# Altium project Sound_Sensor_PoE_v3.2.PrjPcb (part 2 of 4)

## Sheet ADC_Section.SchDoc
size A4; DocumentNumber: 6; SheetNumber: 6; SheetTotal: 11
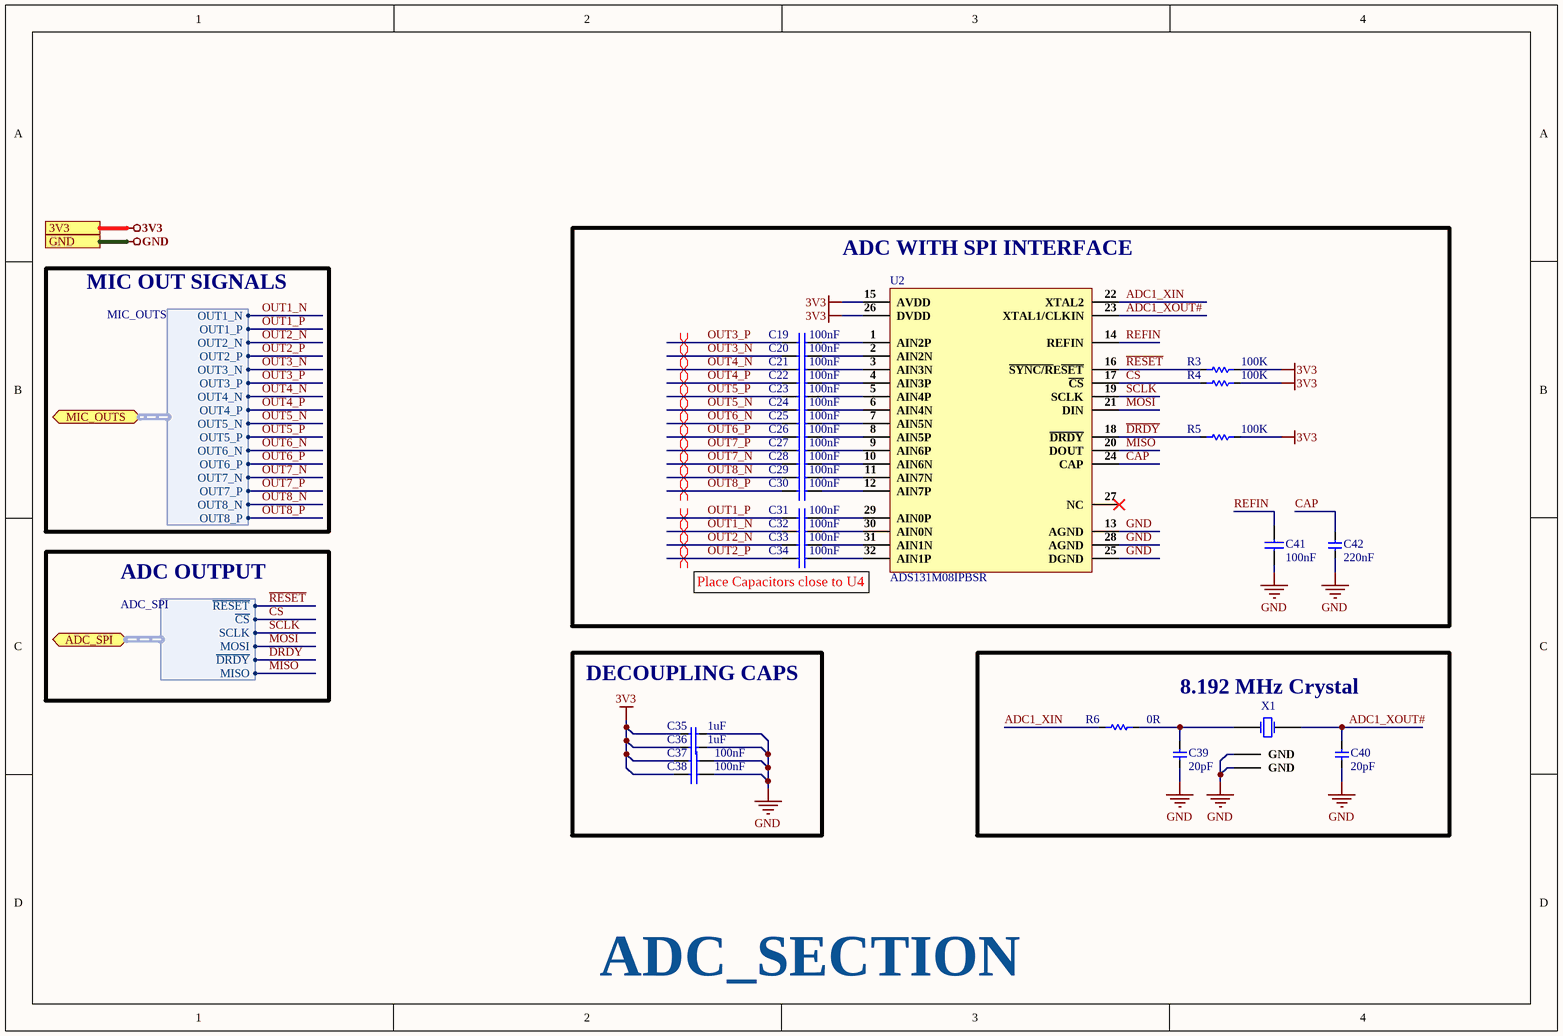
[diagram p4: ADC_Section.SchDoc]

### Parts
C19  100nF  [Cap-0402]
C20  100nF  [Cap-0402]
C21  100nF  [Cap-0402]
C22  100nF  [Cap-0402]
C23  100nF  [Cap-0402]
C24  100nF  [Cap-0402]
C25  100nF  [Cap-0402]
C26  100nF  [Cap-0402]
C27  100nF  [Cap-0402]
C28  100nF  [Cap-0402]
C29  100nF  [Cap-0402]
C30  100nF  [Cap-0402]
C31  100nF  [Cap-0402]
C32  100nF  [Cap-0402]
C33  100nF  [Cap-0402]
C34  100nF  [Cap-0402]
C35  1uF  [Cap-0603]
C36  1uF  [Cap-0603]
C37  100nF  [Cap-0603]
C38  100nF  [Cap-0603]
C39  20pF  [Cap-0603]
C40  20pF  [Cap-0603]
C41  100nF  [Cap-0603]
C42  220nF  [Cap-0805]
R3  100K  [RES-0603]
R4  100K  [RES-0603]
R5  100K  [RES-0603]
R6  0R  [Res-0603]
U2  ADS131M08IPBSR  [32TQFP]
X1  3TJ481920NYLBC  [3TJ481920NYLBC]  (value not drawn)

### Blocks framed on the sheet
ADC WITH SPI INTERFACE: C19-C34 C41 C42 R3-R5 U2
DECOUPLING CAPS: C35-C38
8.192 MHz Crystal: C39 C40 R6 X1

### Ports
3V3, ADC_SPI (bidir, harness ADC_SPI), GND, MIC_OUTS (bidir, harness MIC_OUTS)

### Harnesses
MIC_OUTS: OUT1_N, OUT1_P, OUT2_N, OUT2_P, OUT3_N, OUT3_P, OUT4_N, OUT4_P, OUT5_N, OUT5_P, OUT6_N, OUT6_P, OUT7_N, OUT7_P, OUT8_N, OUT8_P
ADC_SPI: ~{RESET}, ~{CS}, SCLK, MOSI, ~{DRDY}, MISO

### Nets
3V3: C35.1 C36.1 C37.1 C38.1 R3.2 R4.2 R5.2 U2.15(AVDD) U2.26(DVDD) ; port 3V3
GND: C35.2 C36.2 C37.2 C38.2 C39.1 C40.1 C41.2 C42.1 U2.13(AGND) U2.25(DGND) U2.28(AGND) X1.2(GND) X1.4(GND) ; port GND
~{CS}: R4.1 U2.17(~{CS}) ; port ADC_SPI.~{CS}
~{DRDY}: R5.1 U2.18(~{DRDY}) ; port ADC_SPI.~{DRDY}
~{RESET}: R3.1 U2.16(~{SYNC/R}E~{SET}) ; port ADC_SPI.~{RESET}
ADC1_XIN: R6.1 U2.22(XTAL2)
ADC1_XOUT#: C40.2 U2.23(XTAL1/CLKIN) X1.3(OSC2)
CAP: C42.2 U2.24(CAP)
MISO: U2.20(DOUT) ; port ADC_SPI.MISO
MOSI: U2.21(DIN) ; port ADC_SPI.MOSI
OUT1_N: C32.1 ; port MIC_OUTS.OUT1_N  [project net MIC_OUTS.OUT1_N]
OUT1_P: C31.1 ; port MIC_OUTS.OUT1_P  [project net MIC_OUTS.OUT1_P]
OUT2_N: C33.1 ; port MIC_OUTS.OUT2_N  [project net MIC_OUTS.OUT2_N]
OUT2_P: C34.1 ; port MIC_OUTS.OUT2_P  [project net MIC_OUTS.OUT2_P]
OUT3_N: C20.1 ; port MIC_OUTS.OUT3_N  [project net MIC_OUTS.OUT3_N]
OUT3_P: C19.1 ; port MIC_OUTS.OUT3_P  [project net MIC_OUTS.OUT3_P]
OUT4_N: C21.1 ; port MIC_OUTS.OUT4_N  [project net MIC_OUTS.OUT4_N]
OUT4_P: C22.1 ; port MIC_OUTS.OUT4_P  [project net MIC_OUTS.OUT4_P]
OUT5_N: C24.1 ; port MIC_OUTS.OUT5_N  [project net MIC_OUTS.OUT5_N]
OUT5_P: C23.1 ; port MIC_OUTS.OUT5_P  [project net MIC_OUTS.OUT5_P]
OUT6_N: C25.1 ; port MIC_OUTS.OUT6_N  [project net MIC_OUTS.OUT6_N]
OUT6_P: C26.1 ; port MIC_OUTS.OUT6_P  [project net MIC_OUTS.OUT6_P]
OUT7_N: C28.1 ; port MIC_OUTS.OUT7_N  [project net MIC_OUTS.OUT7_N]
OUT7_P: C27.1 ; port MIC_OUTS.OUT7_P  [project net MIC_OUTS.OUT7_P]
OUT8_N: C29.1 ; port MIC_OUTS.OUT8_N  [project net MIC_OUTS.OUT8_N]
OUT8_P: C30.1 ; port MIC_OUTS.OUT8_P  [project net MIC_OUTS.OUT8_P]
REFIN: C41.1 U2.14(REFIN)
SCLK: U2.19(SCLK) ; port ADC_SPI.SCLK
NetC19_2: C19.2 U2.1(AIN2P)
NetC20_2: C20.2 U2.2(AIN2N)
NetC21_2: C21.2 U2.3(AIN3N)
NetC22_2: C22.2 U2.4(AIN3P)
NetC23_2: C23.2 U2.5(AIN4P)
NetC24_2: C24.2 U2.6(AIN4N)
NetC25_2: C25.2 U2.7(AIN5N)
NetC26_2: C26.2 U2.8(AIN5P)
NetC27_2: C27.2 U2.9(AIN6P)
NetC28_2: C28.2 U2.10(AIN6N)
NetC29_2: C29.2 U2.11(AIN7N)
NetC30_2: C30.2 U2.12(AIN7P)
NetC31_2: C31.2 U2.29(AIN0P)
NetC32_2: C32.2 U2.30(AIN0N)
NetC33_2: C33.2 U2.31(AIN1N)
NetC34_2: C34.2 U2.32(AIN1P)
NetC39_2: C39.2 R6.2 X1.1(OSC1)

Not connected (* = marked no-connect by the designer): U2 27(NC)*

### Layout directives
differential pair; differential pair class OUT1_Lines; net class OUT1; rule Impedance Constraint [Min = 85.00    Max = 95.00    ]; rule Matched Net Lengths [Tolerance = 20mil]: MIC_OUTS.OUT1_P
differential pair; differential pair class OUT1_Lines; net class OUT1; rule Matched Net Lengths [Tolerance = 20mil]; rule Impedance Constraint [Min = 85.00    Max = 95.00    ]: MIC_OUTS.OUT1_N
differential pair; differential pair class OUT2_Lines; net class OUT2; rule Matched Net Lengths [Tolerance = 20mil]; rule Impedance Constraint [Min = 85.00    Max = 95.00    ]: MIC_OUTS.OUT2_N, MIC_OUTS.OUT2_P
differential pair; differential pair class OUT3_Lines; net class OUT3; rule Matched Net Lengths [Tolerance = 20mil]; rule Impedance Constraint [Min = 85.00    Max = 95.00    ]: MIC_OUTS.OUT3_N, MIC_OUTS.OUT3_P
differential pair; differential pair class OUT4_Lines; net class OUT4; rule Matched Net Lengths [Tolerance = 20mil]; rule Impedance Constraint [Min = 85.00    Max = 95.00    ]: MIC_OUTS.OUT4_N, MIC_OUTS.OUT4_P
differential pair; differential pair class OUT5_Lines; net class OUT5; rule Matched Net Lengths [Tolerance = 20mil]; rule Impedance Constraint [Min = 85.00    Max = 95.00    ]: MIC_OUTS.OUT5_N, MIC_OUTS.OUT5_P
differential pair; differential pair class OUT6_Lines; net class OUT6; rule Matched Net Lengths [Tolerance = 20mil]; rule Impedance Constraint [Min = 85.00    Max = 95.00    ]: MIC_OUTS.OUT6_N, MIC_OUTS.OUT6_P
differential pair; differential pair class OUT7_Lines; net class OUT7; rule Matched Net Lengths [Tolerance = 20mil]; rule Impedance Constraint [Min = 85.00    Max = 95.00    ]: MIC_OUTS.OUT7_N, MIC_OUTS.OUT7_P
differential pair; differential pair class OUT8_Lines; net class OUT8; rule Matched Net Lengths [Tolerance = 20mil]; rule Impedance Constraint [Min = 85.00    Max = 95.00    ]: MIC_OUTS.OUT8_N, MIC_OUTS.OUT8_P

### Notes on the sheet
- MIC OUT SIGNALS
- ADC OUTPUT
- (near C34) Place Capacitors close to U4
- ADC_SECTION
- File:
- Title:
- Date:
- Page
- Num:
- Total:
- Drawn By: Huzaifa Ali

### Library data of the parts
C19-C34 = CC0402KRX5R7BB104: CAP CER 0.1UF 16V X5R 0402; Manufacturer: Yageo; Tolerance: 10%; Supplier 1: Mouser; Manufacturer Part Number: CC0402KRX5R7BB104; RoHS: Yes; Category: Ceramic Capacitors; Stock 1: 936792; Pricing 1: 1=0.10000, 10=0.02300, 50=0.02300, 100=0.01100, 1000=0.00600, 10000=0.00400 (USD); Mount: Surface Mount; Case/Package: 0402; Number of Pins: 2; Case Code (Metric): 1005; Case Code (Imperial): 0402; Min Operating Temperature: -55°C; Max Operating Temperature: 85°C; Capacitance: 100nF; Dielectric: X5R; Packaging: Tape and Reel; Voltage Rating: 16V; Package Quantity: 1; Voltage Rating (DC): 16V; Termination: SMD/SMT; Resistor Type: Ceramic; Series: CC; Construction: Flat; Length: 1mm; Width: 0.02inch; Height: 0.5mm; Thickness: 0.022inch; Depth: 0.5mm; Radiation Hardening: No; REACH SVHC: Unknown; Lead Free: Lead Free; Halogen Free: Halogen Free; RoHS Compliant: Yes; ComponentLink1URL: https://datasheet.ciiva.com/155/mlccorderingcode-155879.pdf?src-supplier=Digi-Key; ComponentLink1Description: https://datasheet.ciiva.com/155/mlccorderingcode-155879.pdf?src-supplier=Digi-Key; ComponentLink2URL: https://datasheet.ciiva.com/155/mlccorderingcode-155878.pdf?src-supplier=Digi-Key; ComponentLink2Description: https://datasheet.ciiva.com/155/mlccorderingcode-155878.pdf?src-supplier=Digi-Key; ComponentLink3URL: https://datasheet.ciiva.com/155/mlccorderingcode-155880.pdf?src-supplier=Digi-Key; ComponentLink3Description: https://datasheet.ciiva.com/155/mlccorderingcode-155880.pdf?src-supplier=Digi-Key; ComponentLink4URL: https://datasheet.ciiva.com/11464/upy-gphc-x5r-4v-to-50v-12-11464869.pdf?src-supplier=Avnet; ComponentLink4Description: https://datasheet.ciiva.com/11464/upy-gphc-x5r-4v-to-50v-12-11464869.pdf?src-supplier=Avnet; Supplier Part Number 1: 603-CC402KRX5R7BB104; LCSC Part Number: C106204
C35 C36 = CC0603KRX5R8BB105: CAP CER 1UF 25V X5R 0603; Manufacturer: Yageo; Tolerance: 10%; Item Type: Capacitor; Supplier 1: Digi-Key; Manufacturer Part Number: CC0603KRX5R8BB105; RoHS: Yes; Category: Ceramic Capacitors; Stock 1: 919939; Pricing 1: 1=0.12000, 10=0.08400, 50=0.04760, 100=0.03940, 500=0.02764, 1000=0.02288 (USD); Mount: Surface Mount; Case/Package: 0603; Number of Pins: 2; Case Code (Metric): 1608; Case Code (Imperial): 0603; Min Operating Temperature: -55°C; Max Operating Temperature: 85°C; Capacitance: 1uF; Dielectric: X5R; Package Quantity: 1; Voltage Rating: 25V; Packaging: Tape and Reel; Termination: SMD/SMT; Voltage Rating (DC): 25V; Series: CC; Construction: Flat; Length: 1.6mm; Width: 0.031inch; Height: 0.8mm; Thickness: 0.035inch; Depth: 0.8mm; Radiation Hardening: No; REACH SVHC: No SVHC; Lead Free: Lead Free; Halogen Free: Halogen Free; RoHS Compliant: Yes; ComponentLink1URL: https://datasheet.ciiva.com/176/mlccorderingcode-176785.pdf?src-supplier=Digi-Key; ComponentLink1Description: https://datasheet.ciiva.com/176/mlccorderingcode-176785.pdf?src-supplier=Digi-Key; ComponentLink2URL: https://datasheet.ciiva.com/176/mlccorderingcode-176786.pdf?src-supplier=Digi-Key; ComponentLink2Description: https://datasheet.ciiva.com/176/mlccorderingcode-176786.pdf?src-supplier=Digi-Key; ComponentLink3URL: https://datasheet.ciiva.com/176/mlccorderingcode-176787.pdf?src-supplier=Digi-Key; ComponentLink3Description: https://datasheet.ciiva.com/176/mlccorderingcode-176787.pdf?src-supplier=Digi-Key; ComponentLink4URL: https://datasheet.ciiva.com/17436/upy-gphc-x5r-4v-to-50v-12-17436952.pdf?src-supplier=Avnet+Europe; ComponentLink4Description: https://datasheet.ciiva.com/17436/upy-gphc-x5r-4v-to-50v-12-17436952.pdf?src-supplier=Avnet+Europe; ComponentLink5URL: https://datasheet.ciiva.com/7978/1525783-7978171.pdf?src-supplier=Element14; ComponentLink5Description: https://datasheet.ciiva.com/7978/1525783-7978171.pdf?src-supplier=Element14; ComponentLink6URL: https://datasheet.ciiva.com/11586/upy-gphc-x5r-4v-to-50v-12-11586318.pdf?src-supplier=Avnet; ComponentLink6Description: https://datasheet.ciiva.com/11586/upy-gphc-x5r-4v-to-50v-12-11586318.pdf?src-supplier=Avnet; Supplier Part Number 1: 311-1445-1-ND; LCSC Part Number: C14664
C37 C38 C41 = CC0603KRX5R9BB104: CAP CER 0.1UF 50V X5R 0603; Manufacturer: Yageo; Tolerance: 10%; Item Type: Capacitor; Supplier 1: Digi-Key; Manufacturer Part Number: CC0603KRX5R9BB104; RoHS: Yes; Category: Ceramic Capacitors; Stock 1: 152253; Pricing 1: 1=0.10000, 10=0.05200, 50=0.02820, 100=0.02310, 500=0.01648, 1000=0.01294 (USD); Mount: Surface Mount; Case/Package: 0603; Case Code (Imperial): 0603; Case Code (Metric): 1608; Weight: 7.1E-05oz; Min Operating Temperature: -55°C; Max Operating Temperature: 85°C; Capacitance: 100nF; Packaging: Tape and Reel; Voltage Rating: 50V; Dielectric: X5R; Termination: SMD/SMT; Voltage Rating (DC): 50V; Package Quantity: 4000; Length: 0.063inch; Width: 0.031inch; Thickness: 0.035inch; Lead Free: Lead Free; Halogen Free: Halogen Free; ComponentLink1URL: http://www.mouser.com/ds/2/447/Yageo_UPY-GP_NP0_16V-to-50V_9-358835.pdf?src-supplier=Mouser; ComponentLink1Description: http://www.mouser.com/ds/2/447/Yageo_UPY-GP_NP0_16V-to-50V_9-358835.pdf?src-supplier=Mouser; ComponentLink2URL: https://www.yageo.com/upload/media/product/productsearch/datasheet/mlcc/UPY-GPHC_X5R_4V-to-50V_26.pdf?src-supplier=Digi-Key; ComponentLink2Description: https://www.yageo.com/upload/media/product/productsearch/datasheet/mlcc/UPY-GPHC_X5R_4V-to-50V_26.pdf?src-supplier=Digi-Key; ComponentLink3URL: http://www.yageo.com/exep/pages/download/literatures/ProductSelectionGuide%202014_Final_2.pdf?src-supplier=Digi-Key; ComponentLink3Description: http://www.yageo.com/exep/pages/download/literatures/ProductSelectionGuide%202014_Final_2.pdf?src-supplier=Digi-Key; Supplier Part Number 1: 311-4046-1-ND; LCSC Part Number: C110022
C39 C40 = CC0603JRNPO9BN200: CAP CER 20PF 50V C0G/NPO 0603; Manufacturer: Yageo; Tolerance: 5%; Dielectric: C0G; Item Type: Capacitor; Supplier 1: Digi-Key; Manufacturer Part Number: CC0603JRNPO9BN200; Stock 1: 259568; Pricing 1: 1=0.1, 10=0.048, 100=0.0214, 500=0.01526, 1000=0.01198 (USD); Mount: Surface Mount; Case/Package: 0603; Number of Pins: 2; Weight: 7.1E-05oz; Case Code (Imperial): 0603; Case Code (Metric): 1608; Min Operating Temperature: -55°C; Max Operating Temperature: 125°C; Capacitance: 20pF; Package Quantity: 4000; Voltage Rating (DC): 50V; Packaging: Tape and Reel; Voltage Rating: 50V; Termination: SMD/SMT; Composition: Ceramic; Length: 1.6mm; Width: 0.8mm; Thickness: 0.035inch; Depth: 0.8mm; REACH SVHC: Unknown; Lead Free: Lead Free; ComponentLink1URL: http://www.farnell.com/datasheets/1132289.pdf?src-supplier=Element14; ComponentLink1Description: http://www.farnell.com/datasheets/1132289.pdf?src-supplier=Element14; ComponentLink2URL: http://www.yageo.com/documents/recent/UPY-GP_NP0_16V-to-50V_16.pdf?src-supplier=Digi-Key; ComponentLink2Description: http://www.yageo.com/documents/recent/UPY-GP_NP0_16V-to-50V_16.pdf?src-supplier=Digi-Key; Supplier Part Number 1: 311-1424-6-ND; LCSC Part Number: C105621
C42 = 08051C224K4T2A: CAP CER 0.22UF 100V X7R 0805; Manufacturer: Kyocera AVX; Tolerance: 10%; Item Type: Capacitor; Supplier 1: Digi-Key; Manufacturer Part Number: 08051C224K4T2A; RoHS: Yes; Category: Ceramic Capacitors; Stock 1: 151; Pricing 1: 1=0.27000, 10=0.18500, 50=0.12320, 100=0.10470, 500=0.07392, 1000=0.06468 (USD); Mount: Surface Mount; Case/Package: 0805; Contact Plating: Tin; Min Operating Temperature: -55°C; Max Operating Temperature: 125°C; Termination: Wraparound; Capacitance: 220nF; Dielectric: X7R; Voltage Rating (DC): 100V; Length: 2.01mm; RoHS Compliant: Yes; ComponentLink1URL: http://datasheets.avx.com/AutoMLCC.pdf?src-supplier=Avnet+Asia; ComponentLink1Description: http://datasheets.avx.com/AutoMLCC.pdf?src-supplier=Avnet+Asia; Supplier Part Number 1: 478-13049-1-ND; LCSC Part Number: C2176107
R3-R5 = CRGH0603J100K: RES SMD 100K OHM 5% 1/5W 0603; Manufacturer: TE Connectivity; Resistance: 100kR; Temperature Coefficient: 100ppm/°C; Power Rating: 200mW; Voltage Rating: 50V; Number of Resistors: 1; Item Type: Resistor; Supplier 1: Digi-Key; Manufacturer Part Number: CRGH0603J100K; Stock 1: 23277; Pricing 1: 1=0.1, 10=0.049, 100=0.02, 1000=0.00899, 2500=0.0078 (USD); Mount: Surface Mount; Case/Package: 0603; Case Code (Imperial): 0603; Case Code (Metric): 1608; Min Operating Temperature: -55°C; Max Operating Temperature: 125°C; Tolerance: 5%; Packaging: Tape and Reel; Resistor Type: Thick Film,Power resistor; Number of Terminations: 2; Series: CRGH; Termination: Solder; Voltage Rating (DC): 50V; Resistance Tolerance: 5%; Technology: THICK FILM; Length: 1.6mm; Width: 0.8mm; Height: 0.45mm; Depth: 0.8mm; RoHS Compliant: Yes; REACH SVHC: No SVHC; ELV: Compliant; ComponentLink1URL: http://www.farnell.com/datasheets/2007183.pdf?src-supplier=Element14; ComponentLink1Description: http://www.farnell.com/datasheets/2007183.pdf?src-supplier=Element14; Supplier Part Number 1: A126393DKR-ND; LCSC Part Number: C2074142
R6 = RC0603JR-070RL: RES 0 OHM JUMPER 1/10W 0603; Manufacturer: Yageo; Resistance: 0mR; Tolerance: 1%; Power Rating: 100mW; Voltage Rating (DC): 50V; Temperature Coefficient: 200ppm/°C; Resistance Tolerance: 5%; Item Type: Resistor; Supplier 1: Digi-Key; Manufacturer Part Number: RC0603JR-070RL; RoHS: Yes; Category: Chip SMD Resistors; Stock 1: 18081776; Pricing 1: 1=0.10000, 10=0.01700, 25=0.01240, 50=0.00960, 100=0.00700, 250=0.00536, 500=0.00430, 1000=0.00316 (USD); Case/Package: 0603; Number of Pins: 2; Contact Plating: Tin,Matte; Case Code (Imperial): 0603; Case Code (Metric): 1608; Size Code: 0603; Min Operating Temperature: -55°C; Max Operating Temperature: 155°C; Resistor Type: Thick Film; Packaging: Tape and Reel; Termination: SMD/SMT; Series: RC; Technology: THICK FILM; Package Quantity: 5000; Voltage Rating: 50V; Features: Moisture Resistant; Max Power Dissipation: 100mW; Number of Terminations: 2; Construction: Rectangular; Length: 1.6mm; Width: 0.8mm; Height: 0.45mm; Depth: 0.8mm; Radiation Hardening: No; Reach SVHC Compliant: No SVHC; Lead Free: Lead Free; RoHS Compliant: Yes; Military Standard: Not; Supplier Part Number 1: 311-0.0GRCT-ND; LCSC Part Number: C95177
U2 = ADS131M08IPBSR: IC ADC 24BIT SIGMA-DELTA 32TQFP; Manufacturer: Texas Instruments; Supplier 1: Mouser; Manufacturer Part Number: ADS131M08IPBSR; RoHS: Yes; Category: Analog to Digital Converters (ADCs); Pricing 1: 1=8.85000, 10=7.99000, 50=7.62000, 100=6.62000, 1000=5.39000, 10000=5.39000 (USD); Supplier Part Number 1: 595-ADS131M08IPBSR
X1 = 3TJ481920NYLBC: 8.192MHz SMD Crystal Resonator 12pF 150Ω ±10ppm ±30ppm -40℃~+85℃ SMD_3225_4P Crystals ROHS; Manufacturer: JYJE; Manufacturer Part No: 3TJ481920NYLBC; Package: Custom

## Sheet Controller_Sheet.SchDoc
size A4; DocumentNumber: 5; SheetNumber: 5; SheetTotal: 11
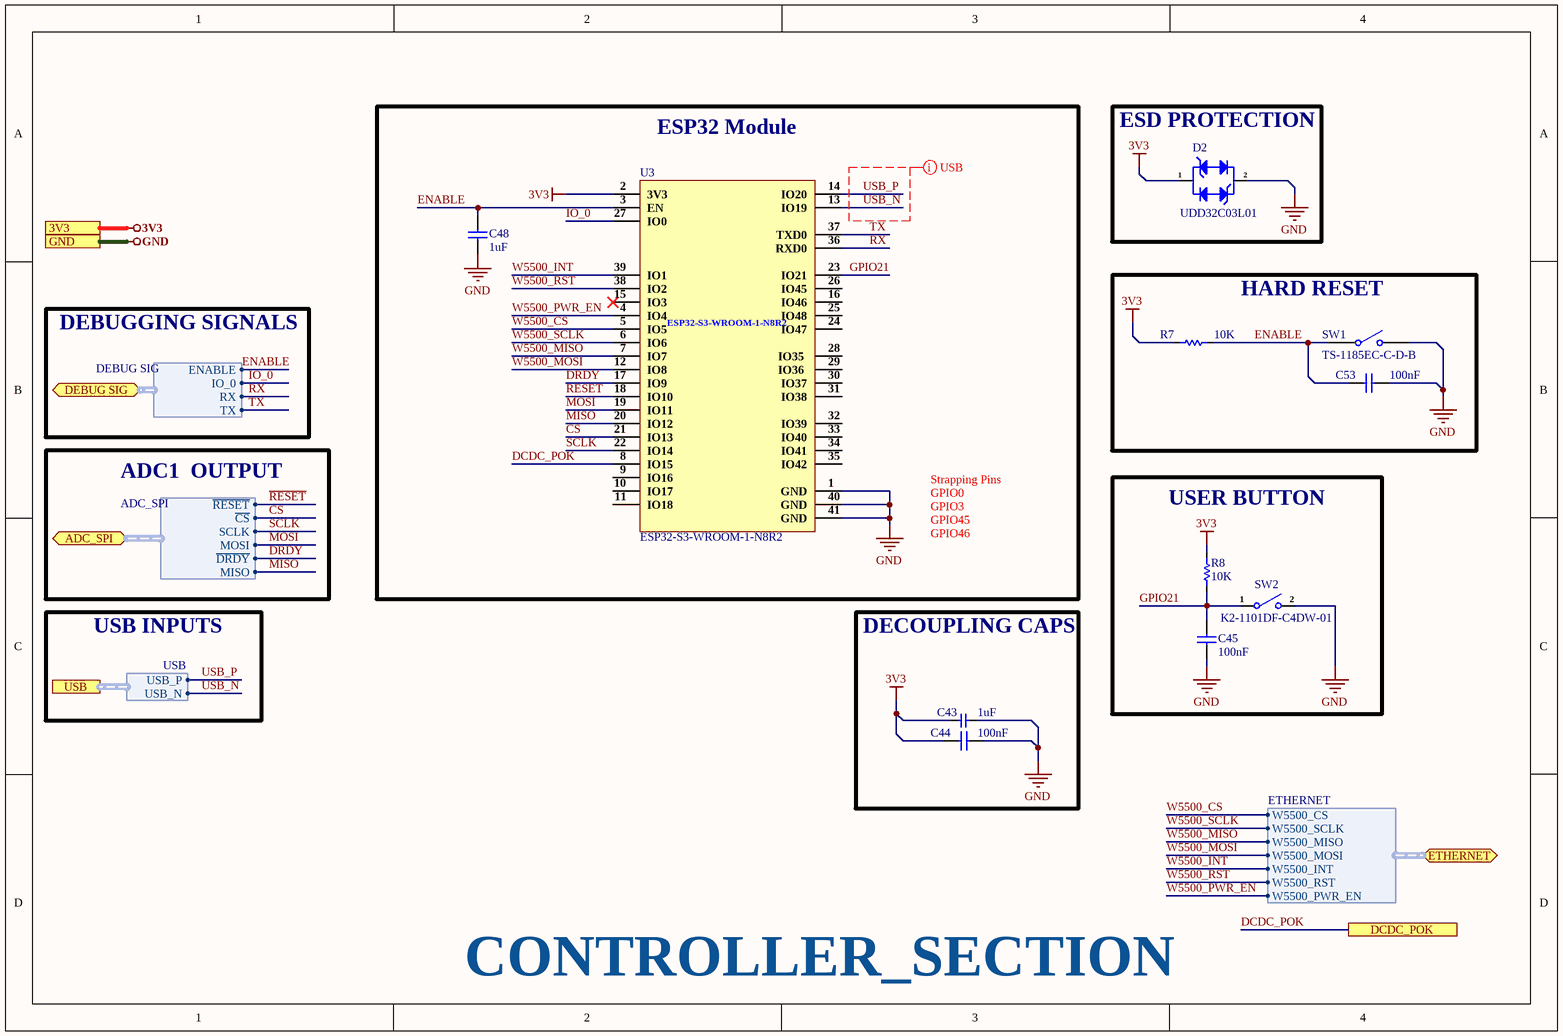
[diagram p5: Controller_Sheet.SchDoc]

### Parts
C43  1uF  [Cap-0603]
C44  100nF  [Cap-0603]
C45  100nF  [Cap-0603]
C48  1uF  [Cap-0402]
C53  100nF  [Cap-0603]
D2  UDD32C03L01  [SOD-323]
R7  10K  [Res-0603]
R8  10K  [Res-0603]
SW1  TS-1185EC-C-D-B  [TS-1185EC-C-D-B]
SW2  K2-1101DF-C4DW-01  [K2-1101DF-C4DW-01]
U3  ESP32-S3-WROOM-1-N8R2  [41-SMD Module]

### Blocks framed on the sheet
ESP32 Module: C48 U3
ESD PROTECTION: D2
HARD RESET: C53 R7 SW1
USER BUTTON: C45 R8 SW2
DECOUPLING CAPS: C43 C44

### Ports
3V3, ADC_SPI (bidir, harness ADC_SPI), DCDC_POK, DEBUG SIG (bidir, harness DEBUG SIG), ETHERNET (bidir, harness ETHERNET), GND, USB (harness USB)

### Harnesses
ADC_SPI: ~{RESET}, ~{CS}, SCLK, MOSI, ~{DRDY}, MISO
USB: USB_P, USB_N
DEBUG SIG: ENABLE, IO_0, RX, TX
ETHERNET: W5500_CS, W5500_SCLK, W5500_MISO, W5500_MOSI, W5500_PWR_EN, W5500_INT, W5500_RST

### Nets
3V3: C43.1 C44.1 D2.1 R7.1 R8.2 U3.2(3V3) ; port 3V3
GND: C43.2 C44.2 C45.1 C48.1 C53.2 D2.2 SW1.2 SW2.2 U3.1(GND) U3.40(GND) U3.41(GND) ; port GND
~{CS}: U3.21(IO13) ; port ADC_SPI.~{CS}
~{DRDY}: U3.17(IO9) ; port ADC_SPI.~{DRDY}
~{RESET}: U3.18(IO10) ; port ADC_SPI.~{RESET}
DCDC_POK: U3.8(IO15) ; port DCDC_POK
ENABLE: C48.2 C53.1 R7.2 SW1.1 U3.3(EN) ; port DEBUG SIG.ENABLE  [project net DEBUG SIG.ENABLE]
GPIO21: C45.2 R8.1 SW2.1 U3.23(IO21)
IO_0: U3.27(IO0) ; port DEBUG SIG.IO_0  [project net DEBUG SIG.IO_0]
MISO: U3.20(IO12) ; port ADC_SPI.MISO
MOSI: U3.19(IO11) ; port ADC_SPI.MOSI
RX: U3.36(RXD0) ; port DEBUG SIG.RX  [project net DEBUG SIG.RX]
SCLK: U3.22(IO14) ; port ADC_SPI.SCLK
TX: U3.37(TXD0) ; port DEBUG SIG.TX  [project net DEBUG SIG.TX]
USB_N: U3.13(IO19) ; port USB.USB_N  [project net USB.USB_N]
USB_P: U3.14(IO20) ; port USB.USB_P  [project net USB.USB_P]
W5500_CS: U3.5(IO5) ; port ETHERNET.W5500_CS
W5500_INT: U3.39(IO1) ; port ETHERNET.W5500_INT
W5500_MISO: U3.7(IO7) ; port ETHERNET.W5500_MISO
W5500_MOSI: U3.12(IO8) ; port ETHERNET.W5500_MOSI
W5500_PWR_EN: U3.4(IO4) ; port ETHERNET.W5500_PWR_EN
W5500_RST: U3.38(IO2) ; port ETHERNET.W5500_RST
W5500_SCLK: U3.6(IO6) ; port ETHERNET.W5500_SCLK

Not connected (* = marked no-connect by the designer): U3 9(IO16) 10(IO17) 11(IO18) 15(IO3)* 16(IO46) 24(IO47) 25(IO48) 26(IO45) 28(IO35_) 29(IO36_) 30(IO37) 31(IO38) 32(IO39) 33(IO40) 34(IO41) 35(IO42)

### Layout directives
differential pair; net class USB; differential pair class USB_Lines; rule Matched Net Lengths [Tolerance = 20mil]; rule Impedance Constraint [Min = 85.00    Max = 95.00    ]: USB_N, USB_P

### Notes on the sheet
- DEBUGGING SIGNALS
- ADC1  OUTPUT
- Strapping Pins
  GPIO0
  GPIO3
  GPIO45
  GPIO46
- USB INPUTS
- CONTROLLER_SECTION
- File:
- Title:
- Date:
- Page
- Num:
- Total:
- Drawn By: Huzaifa Ali

### Library data of the parts
C43 = CC0603KRX5R8BB105: as C35 on sheet ADC_Section; Supplier 1: Digi-Key; Manufacturer Part Number: CC0603KRX5R8BB105; RoHS: Yes; Category: Ceramic Capacitors; Stock 1: 919939; Pricing 1: 1=0.12000, 10=0.08400, 50=0.04760, 100=0.03940, 500=0.02764, 1000=0.02288 (USD); Mount: Surface Mount; Case/Package: 0603; Case Code (Metric): 1608; Case Code (Imperial): 0603; Min Operating Temperature: -55°C; Max Operating Temperature: 85°C; Packaging: Tape and Reel; Capacitance: 1uF; Voltage Rating: 25V; Dielectric: X5R; Termination: SMD/SMT; Voltage Rating (DC): 25V; Package Quantity: 1; Length: 1.6mm; Width: 0.031inch; Thickness: 0.035inch; Lead Free: Lead Free; Halogen Free: Halogen Free; RoHS Compliant: Yes; ComponentLink1URL: https://datasheet.ciiva.com/176/mlccorderingcode-176785.pdf?src-supplier=Digi-Key; ComponentLink1Description: https://datasheet.ciiva.com/176/mlccorderingcode-176785.pdf?src-supplier=Digi-Key; ComponentLink2URL: https://datasheet.ciiva.com/176/mlccorderingcode-176786.pdf?src-supplier=Digi-Key; ComponentLink2Description: https://datasheet.ciiva.com/176/mlccorderingcode-176786.pdf?src-supplier=Digi-Key; ComponentLink3URL: https://datasheet.ciiva.com/176/mlccorderingcode-176787.pdf?src-supplier=Digi-Key; ComponentLink3Description: https://datasheet.ciiva.com/176/mlccorderingcode-176787.pdf?src-supplier=Digi-Key; Supplier Part Number 1: 311-1445-1-ND; LCSC Part Number: C14664; Number of Pins: 2; Series: CC; Construction: Flat; Height: 0.8mm; Depth: 0.8mm; Radiation Hardening: No; REACH SVHC: No SVHC; ComponentLink4URL: https://datasheet.ciiva.com/17436/upy-gphc-x5r-4v-to-50v-12-17436952.pdf?src-supplier=Avnet+Europe; ComponentLink4Description: https://datasheet.ciiva.com/17436/upy-gphc-x5r-4v-to-50v-12-17436952.pdf?src-supplier=Avnet+Europe; ComponentLink5URL: https://datasheet.ciiva.com/7978/1525783-7978171.pdf?src-supplier=Element14; ComponentLink5Description: https://datasheet.ciiva.com/7978/1525783-7978171.pdf?src-supplier=Element14; ComponentLink6URL: https://datasheet.ciiva.com/11586/upy-gphc-x5r-4v-to-50v-12-11586318.pdf?src-supplier=Avnet; ComponentLink6Description: https://datasheet.ciiva.com/11586/upy-gphc-x5r-4v-to-50v-12-11586318.pdf?src-supplier=Avnet
C44 C45 C53 = CC0603KRX5R9BB104: as C37 on sheet ADC_Section; Supplier 1: Digi-Key; Manufacturer Part Number: CC0603KRX5R9BB104; RoHS: Yes; Category: Ceramic Capacitors; Stock 1: 152253; Pricing 1: 1=0.10000, 10=0.05200, 50=0.02820, 100=0.02310, 500=0.01648, 1000=0.01294 (USD); Mount: Surface Mount; Case/Package: 0603; Case Code (Imperial): 0603; Case Code (Metric): 1608; Weight: 7.1E-05oz; Min Operating Temperature: -55°C; Max Operating Temperature: 85°C; Capacitance: 100nF; Packaging: Tape and Reel; Voltage Rating: 50V; Dielectric: X5R; Termination: SMD/SMT; Voltage Rating (DC): 50V; Package Quantity: 4000; Length: 0.063inch; Width: 0.031inch; Thickness: 0.035inch; Lead Free: Lead Free; Halogen Free: Halogen Free; ComponentLink1URL: http://www.mouser.com/ds/2/447/Yageo_UPY-GP_NP0_16V-to-50V_9-358835.pdf?src-supplier=Mouser; ComponentLink1Description: http://www.mouser.com/ds/2/447/Yageo_UPY-GP_NP0_16V-to-50V_9-358835.pdf?src-supplier=Mouser; ComponentLink2URL: https://www.yageo.com/upload/media/product/productsearch/datasheet/mlcc/UPY-GPHC_X5R_4V-to-50V_26.pdf?src-supplier=Digi-Key; ComponentLink2Description: https://www.yageo.com/upload/media/product/productsearch/datasheet/mlcc/UPY-GPHC_X5R_4V-to-50V_26.pdf?src-supplier=Digi-Key; ComponentLink3URL: http://www.yageo.com/exep/pages/download/literatures/ProductSelectionGuide%202014_Final_2.pdf?src-supplier=Digi-Key; ComponentLink3Description: http://www.yageo.com/exep/pages/download/literatures/ProductSelectionGuide%202014_Final_2.pdf?src-supplier=Digi-Key; Supplier Part Number 1: 311-4046-1-ND; LCSC Part Number: C110022
C48 = CC0402KRX5R8BB105: CAP CER 1UF 25V X5R 0402; Manufacturer: Yageo; Tolerance: 10%; Supplier 1: Mouser; Manufacturer Part Number: CC0402KRX5R8BB105; RoHS: Yes; Category: Ceramic Capacitors; Stock 1: 91975; Pricing 1: 1=0.30000, 10=0.20400, 50=0.20400, 100=0.11600, 1000=0.07200, 10000=0.05900 (USD); Mount: Surface Mount; Case/Package: 0402; Case Code (Metric): 1005; Case Code (Imperial): 0402; Weight: 2.3E-05oz; Min Operating Temperature: -55°C; Max Operating Temperature: 85°C; Packaging: Tape and Reel; Capacitance: 1uF; Voltage Rating: 25V; Dielectric: X5R; Termination: SMD/SMT; Voltage Rating (DC): 25V; Package Quantity: 10000; Length: 0.039inch; Width: 0.02inch; Thickness: 0.022inch; Lead Free: Lead Free; Halogen Free: Halogen Free; RoHS Compliant: Yes; ComponentLink1URL: http://www.mouser.com/ds/2/447/Yageo_UPY-GP_NP0_16V-to-50V_9-358835.pdf?src-supplier=Mouser; ComponentLink1Description: http://www.mouser.com/ds/2/447/Yageo_UPY-GP_NP0_16V-to-50V_9-358835.pdf?src-supplier=Mouser; ComponentLink2URL: http://www.yageo.com/documents/recent/UPY-GPHC_X5R_4V-to-50V_25.pdf?src-supplier=Digi-Key; ComponentLink2Description: http://www.yageo.com/documents/recent/UPY-GPHC_X5R_4V-to-50V_25.pdf?src-supplier=Digi-Key; ComponentLink3URL: https://4donline.ihs.com/images/VipMasterIC/IC/YAGO/YAGO-S-A0006851646/YAGO-S-A0006851646-1.pdf?hkey=6D3A4C79FDBF58556ACFDE234799DDF0&src-supplier=Newark; ComponentLink3Description: https://4donline.ihs.com/images/VipMasterIC/IC/YAGO/YAGO-S-A0006851646/YAGO-S-A0006851646-1.pdf?hkey=6D3A4C79FDBF58556ACFDE234799DDF0&src-supplier=Newark; Supplier Part Number 1: 603-CC402KRX5R8BB105; LCSC Part Number: C326568
D2 = UDD32C03L01: 15V 19A 3.3V 4V Bidirectional SOD-323 ESD Protection Devices ROHS; Manufacturer: Brightking; Item Type: ESD Diode; Manufacturer Part Number: UDD32C03L01; ComponentLink1Description: LCSC; ComponentLink1URL: https://lcsc.com/product-detail/span-style-background-color-ff0-ESD-span-Protection-Devices_Brightking-Elec-TAIWAN-UDD32C03L01_C78439.html; LCSC Part Number: C78439
R7 R8 = AC0603JR-0710KL: RES SMD 10K OHM 5% 1/10W 0603; Manufacturer: Yageo; Voltage Rating: 50V; Resistance: 10kR; Power Rating: 100mW; Temperature Coefficient: 100ppm/°C; Item Type: Resistor; Supplier 1: Future Electronics; Manufacturer Part Number: AC0603JR-0710KL; RoHS: Yes; Category: Chip SMD Resistors; Stock 1: 1533000; Pricing 1: 5000=0.00540 (USD); Case/Package: 0603; Case Code (Imperial): 0603; Case Code (Metric): 1608; Size Code: 0603; Min Operating Temperature: -55°C; Max Operating Temperature: 155°C; Packaging: Tape and Reel; Tolerance: 5%; Package Quantity: 1; Resistor Type: Thick Film; Termination: SMD/SMT; Number of Terminations: 2; Max Power Dissipation: 100mW; Features: Moisture Resistant,Automotive AEC-Q200,Anti-Sulfur; Series: AC; Construction: Rectangular; Length: 0.063inch; Width: 0.031inch; Height: 0.022inch; Depth: 0.8mm; Military Standard: Not; Lead Free: Lead Free; RoHS Compliant: Yes; ComponentLink1URL: https://datasheet.ciiva.com/5562/pyu-ac-51-rohs-l-2-5562553.pdf?src-supplier=Mouser; ComponentLink1Description: https://datasheet.ciiva.com/5562/pyu-ac-51-rohs-l-2-5562553.pdf?src-supplier=Mouser; Supplier Part Number 1: 1029044; LCSC Part Number: C140867
SW1 = TS-1185EC-C-D-B: 3mm 2mm Round Button 50mA Top3.65mm SPST 12V SMD Tactile Switches; Manufacturer: XKB; Manufacturer Part No: TS-1185EC-C-D-B; Package: Custom; ComponentLink1Description: LCSC; ComponentLink1URL: https://lcsc.com/product-detail/Tactile-Switches_XKB-Connectivity-TS-1185EC-C-D-B_C318893.html
SW2 = K2-1101DF-C4DW-01: 50mA Lying 100MΩ 100000 Times 250gf@±30gf 12V Plugin Tactile Switches ROHS; Manufacturer: Korean Hroparts Elec; Manufacturer Part Number: K2-1101DF-C4DW-01; Package: Plugin; LCSC Part Number: C502329; Item Type: Tactile Switch; ComponentLink1Description: LCSC; ComponentLink1URL: https://www.lcsc.com/product-detail/Tactile-Switches_Korean-Hroparts-Elec-K2-1101DF-C4DW-01_C502329.html
U3 = ESP32-S3-WROOM-1-N8R2: SMD,18x25.5mm WiFi Modules ROHS; Manufacturer: Espressif Systems; Item Type: Module; Supplier 1: Digi-Key; Manufacturer Part Number: ESP32-S3-WROOM-1-N8R2; RoHS: No; Category: Uncategorized; Supplier Part Number 1: 1965-ESP32-S3-WROOM-1-N8R2-ND; LCSC Part Number: C2913204; ComponentLink1Description: LCSC; ComponentLink1URL: https://www.lcsc.com/product-detail/WiFi-Modules_Espressif-Systems-ESP32-S3-WROOM-1-N8R2_C2913204.html

## Sheet Ethernet_PoE.SchDoc
size A3
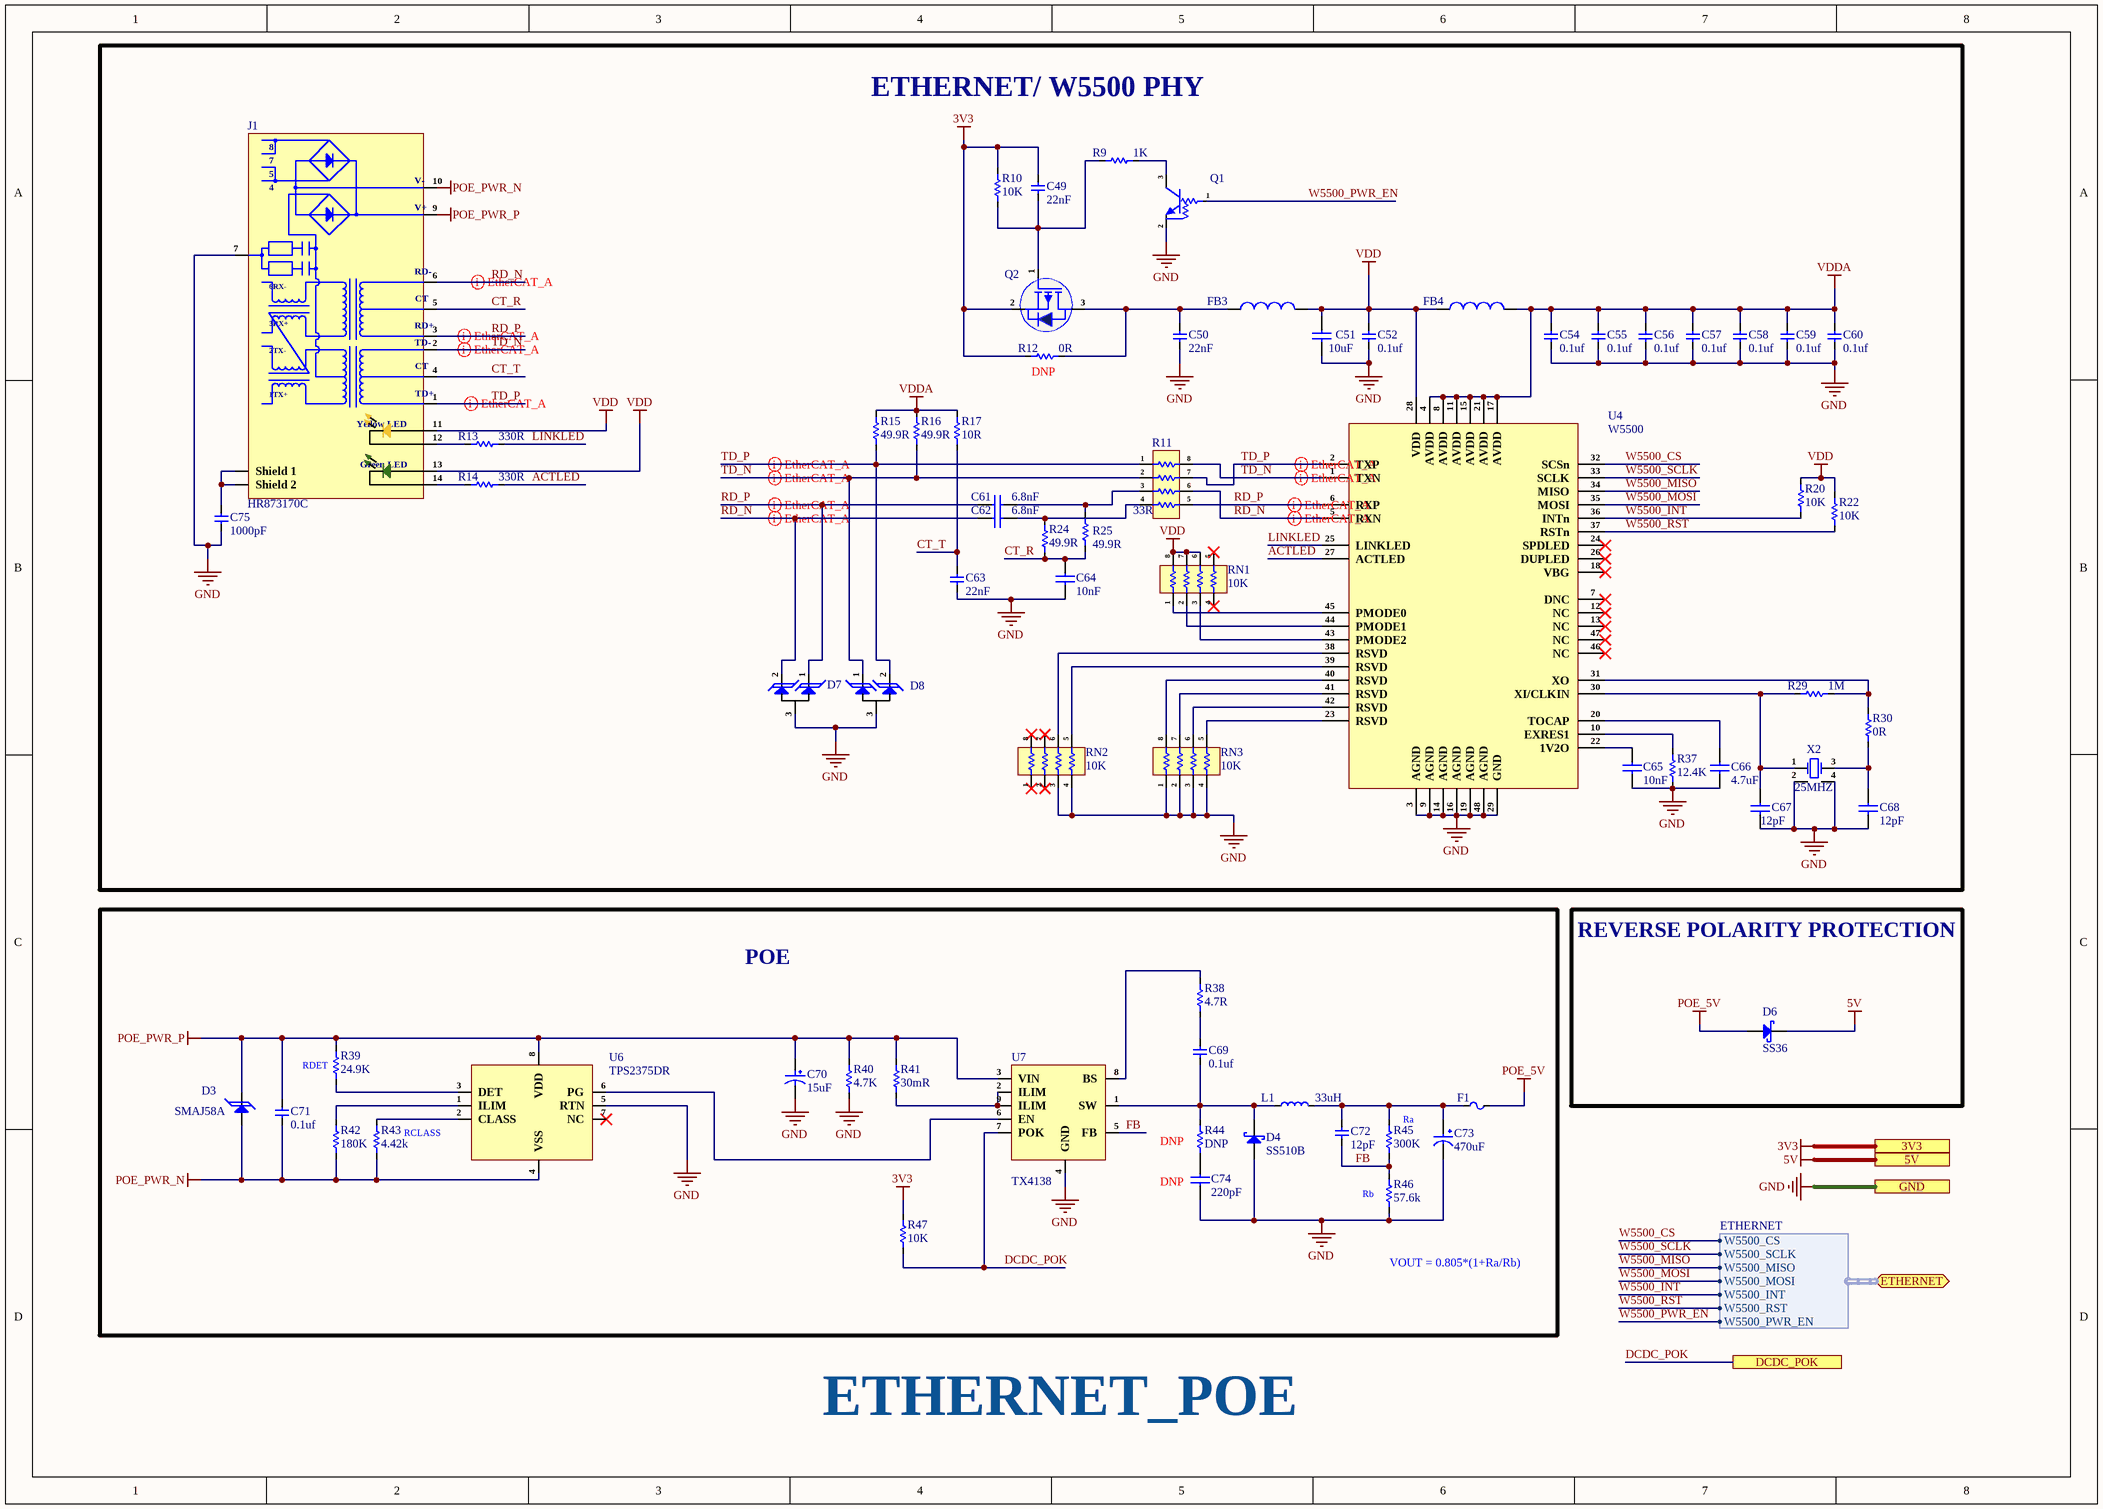
[diagram p6: Ethernet_PoE.SchDoc]

### Parts
C49  22nF  [Cap-0402]
C50  22nF  [Cap-0402]
C51  10uF  [Cap-0603]
C52  0.1uf  [Cap-0402]
C54  0.1uf  [Cap-0402]
C55  0.1uf  [Cap-0402]
C56  0.1uf  [Cap-0402]
C57  0.1uf  [Cap-0402]
C58  0.1uf  [Cap-0402]
C59  0.1uf  [Cap-0402]
C60  0.1uf  [Cap-0402]
C61  6.8nF  [Cap-0603]
C62  6.8nF  [Cap-0603]
C63  22nF  [Cap-0402]
C64  10nF  [Cap-0603]
C65  10nF  [Cap-0603]
C66  4.7uF  [Cap-0603]
C67  12pF  [Cap-0603]
C68  12pF  [Cap-0603]
C69  0.1uf  [Cap-0402]
C70  15uF  [VMMC0571J150MV]
C71  0.1uf  [Cap-0402]
C72  12pF  [Cap-0603]
C73  470uF  [Case-E]
C74  220pF  [Cap 0402]
C75  1000pF  [Cap-1206]
D3  SMAJ58A  [SMA]
D4  SS510B  [SMB_]
D6  SS36  [SMA]
D7  SP0502BAHTG  [SOT-23]  (value not drawn)
D8  SP0502BAHTG  [SOT-23]  (value not drawn)
F1  BSMD0805L-200  [Fuse-0805]  (value not drawn)
FB3  FBMH3225HM601NT  [IND-1210]  (value not drawn)
FB4  FBMH3225HM601NT  [IND-1210]  (value not drawn)
J1  HR873170C  [HR873170C]
L1  33uH  [MDA7050_330M]
Q1  LMUN2211LT1G  [SOT-23]  (value not drawn)
Q2  AO3407  [SOT-23]  (value not drawn)
R9  1K  [Res-0603]
R10  10K  [Res-0603]
R11  33R  [YC164-JR-0733RL]
R12  0R  [Res-0603]
R13  330R  [Res-0603]
R14  330R  [Res-0603]
R15  49.9R  [Res-0201]
R16  49.9R  [Res-0201]
R17  10R  [Res-0603]
R20  10K  [Res-0603]
R22  10K  [Res-0603]
R24  49.9R  [Res-0201]
R25  49.9R  [Res-0201]
R29  1M  [Res-0603]
R30  0R  [Res-0603]
R37  12.4K  [Res-0603]
R38  4.7R  [Res-0201]
R39  24.9K  [Res-0201]
R40  4.7K  [Res-0402]
R41  30mR  [RES-0805]
R42  180K  [Res-0201]
R43  4.42k  [Res-0201]
R44  DNP  [Res-0603]
R45  300K  [Res-0201]
R46  57.6k  [Res-0201]
R47  10K  [Res-0603]
RN1  10K  [YC164-FR-0710KL]
RN2  10K  [YC164-FR-0710KL]
RN3  10K  [YC164-FR-0710KL]
U4  W5500  [48-LQFP (7x7)_]
U6  TPS2375DR  [SOIC-8]
U7  TX4138  [8-SOIC-EP]
X2  25MHZ  [NX3225GA-25MHZ-STD-CRG-2]

### Blocks framed on the sheet
ETHERNET/ W5500 PHY: C49-C52 C54-C68 C75 D7 D8 FB3 FB4 J1 Q1 Q2 R9-R17 R20 R22 R24 R25 R29 R30 R37 RN1-RN3 U4 X2
POE: C69-C74 D3 D4 F1 L1 R38-R47 U6 U7
REVERSE POLARITY PROTECTION: D6

### Ports
3V3, 5V, DCDC_POK, ETHERNET (bidir, harness ETHERNET), GND

### Harnesses
ETHERNET: W5500_CS, W5500_SCLK, W5500_MISO, W5500_MOSI, W5500_PWR_EN, W5500_INT, W5500_RST

### Nets
3V3: C49.2 Q2.2(S) R10.2 R12.2 R47.2 ; port 3V3
5V: D6.1(K) ; port 5V
GND: C50.1 C51.1 C52.1 C54.1 C55.1 C56.1 C57.1 C58.1 C59.1 C60.1 C63.1 C64.1 C65.1 C66.1 C67.1 C68.1 C70.2 C73.2 C74.1 C75.1 D4.1(A) D7.3(A) D8.3(A) J1.7(GND) Q1.2(E) R37.1 R40.1 R46.1 RN2.3 RN2.4 RN3.1 RN3.2 RN3.3 RN3.4 U4.3(AGND) U4.9(AGND) U4.14(AGND) U4.16(AGND) U4.19(AGND) U4.29(GND) U4.48(AGND) U6.5(RTN) U7.4(GND) X2.2(GND) X2.4(OSC3) ; port GND
POE_5V: D6.2(A) F1.2
POE_PWR_N: C71.1 D3.2(K) J1.10(V-) R42.1 R43.1 U6.4(VSS)
POE_PWR_P: C70.1 C71.2 D3.1(K) J1.9(V+) R39.2 R40.2 R41.2 U6.8(VDD) U7.3(VIN)
VDD: C51.2 C52.2 FB3.2 FB4.1 J1.11(ANODE) J1.13(ANODE) R20.2 R22.2 RN1.6 RN1.7 RN1.8 U4.28(VDD)
VDDA: C54.2 C55.2 C56.2 C57.2 C58.2 C59.2 C60.2 FB4.2 R15.2 R16.2 R17.2 U4.4(AVDD) U4.8(AVDD) U4.11(AVDD) U4.15(AVDD) U4.17(AVDD) U4.21(AVDD)
ACTLED: R14.2 U4.27(ACTLED)
CT_R: C64.2 J1.5(CT) R24.1 R25.1
CT_T: C63.2 J1.4(CT) R17.1
DCDC_POK: R47.1 U7.7(POK) ; port DCDC_POK
FB: C72.1 R45.1 R46.2 U7.5(FB)
LINKLED: R13.2 U4.25(LINKLED)
RD_N: C62.1 D7.2(K) J1.6(RD-) R11.6 U4.5(RXN)
RD_P: C61.1 D7.1(K) J1.3(RD+) R11.5 U4.6(RXP)
TD_N: D8.1(K) J1.2(TD-) R11.2 R11.8 R16.1 U4.1(TXN)
TD_P: D8.2(K) J1.1(TD+) R11.1 R11.7 R15.1 U4.2(TXP)
W5500_CS: U4.32(SCSn) ; port ETHERNET.W5500_CS
W5500_INT: R20.1 U4.36(INTn) ; port ETHERNET.W5500_INT
W5500_MISO: U4.34(MISO) ; port ETHERNET.W5500_MISO
W5500_MOSI: U4.35(MOSI) ; port ETHERNET.W5500_MOSI
W5500_PWR_EN: Q1.1(B) ; port ETHERNET.W5500_PWR_EN
W5500_RST: R22.1 U4.37(RSTn) ; port ETHERNET.W5500_RST
W5500_SCLK: U4.33(SCLK) ; port ETHERNET.W5500_SCLK
NetC49_1: C49.1 Q2.1(G) R9.1 R10.1
NetC50_2: C50.2 FB3.1 Q2.3(D) R12.1
NetC61_2: C61.2 R11.3 R25.2
NetC62_2: C62.2 R11.4 R24.2
NetC65_2: C65.2 U4.22(1V2O)
NetC66_2: C66.2 U4.20(TOCAP)
NetC67_2: C67.2 R29.1 U4.30(XI/CLKIN) X2.1(OSC1)
NetC68_2: C68.2 R30.1 X2.3(OSC2)
NetC69_1: C69.1 D4.2(K) L1.1 R44.2 U7.1(SW)
NetC69_2: C69.2 R38.1
NetC72_2: C72.2 C73.1 F1.1 L1.2 R45.2
NetC74_2: C74.2 R44.1
NetC75_2: C75.2 J1.Shield_1 J1.Shield_2
NetJ1_12: J1.12(CATHODE) R13.1
NetJ1_14: J1.14(CATHODE) R14.1
NetQ1_3: Q1.3(C) R9.2
NetR29_2: R29.2 R30.2 U4.31(XO)
NetR37_2: R37.2 U4.10(EXRES1)
NetR38_2: R38.2 U7.8(BS)
NetR39_1: R39.1 U6.3(DET)
NetR41_1: R41.1 U7.2(ILIM) U7.9(ILIM)
NetR42_2: R42.2 U6.1(ILIM)
NetR43_2: R43.2 U6.2(CLASS)
NetRN1_1: RN1.1 U4.45(PMODE0)
NetRN1_2: RN1.2 U4.44(PMODE1)
NetRN1_3: RN1.3 U4.43(PMODE2)
NetRN2_5: RN2.5 U4.39(RSVD)
NetRN2_6: RN2.6 U4.38(RSVD)
NetRN3_5: RN3.5 U4.23(RSVD)
NetRN3_6: RN3.6 U4.42(RSVD)
NetRN3_7: RN3.7 U4.41(RSVD)
NetRN3_8: RN3.8 U4.40(RSVD)
NetU6_6: U6.6(PG) U7.6(EN)

Not connected (* = marked no-connect by the designer): RN1 4* 5*; RN2 1* 2* 7* 8*; U4 7(DNC)* 12(NC)* 13(NC)* 18(VBG)* 24(SPDLED)* 26(DUPLED)* 46(NC)* 47(NC)*; U6 7(NC)*

### Layout directives
differential pair; differential pair class EtherCAT_A_Lines; net class EtherCAT_A; rule Matched Net Lengths [Tolerance = 20mil]; rule Impedance Constraint [Min = 85.00    Max = 95.00    ]: RD_N, RD_P, TD_N, TD_P
differential pair; differential pair class Ethernet_Lines; net class Ethernet; rule Matched Net Lengths [Tolerance = 20mil]; rule Impedance Constraint [Min = 97.00    Max = 105.0    ]: RD_P, TD_N, TD_P

### Notes on the sheet
- (near R12) DNP
- (near R39) RDET
- (near R45) Ra
- RCLASS
- (near R44) DNP
- (near C74) DNP
- (near R46) Rb
- (near R46) VOUT = 0.805*(1+Ra/Rb)
- ETHERNET_POE
- (in symbol HR873170C) 8; 6RX-; 3RX+; 2TX-; 1TX+; Yellow LED; Green LED